# EAGLE design AUDIO_final_rev03 (EAGLE 9.6.2)
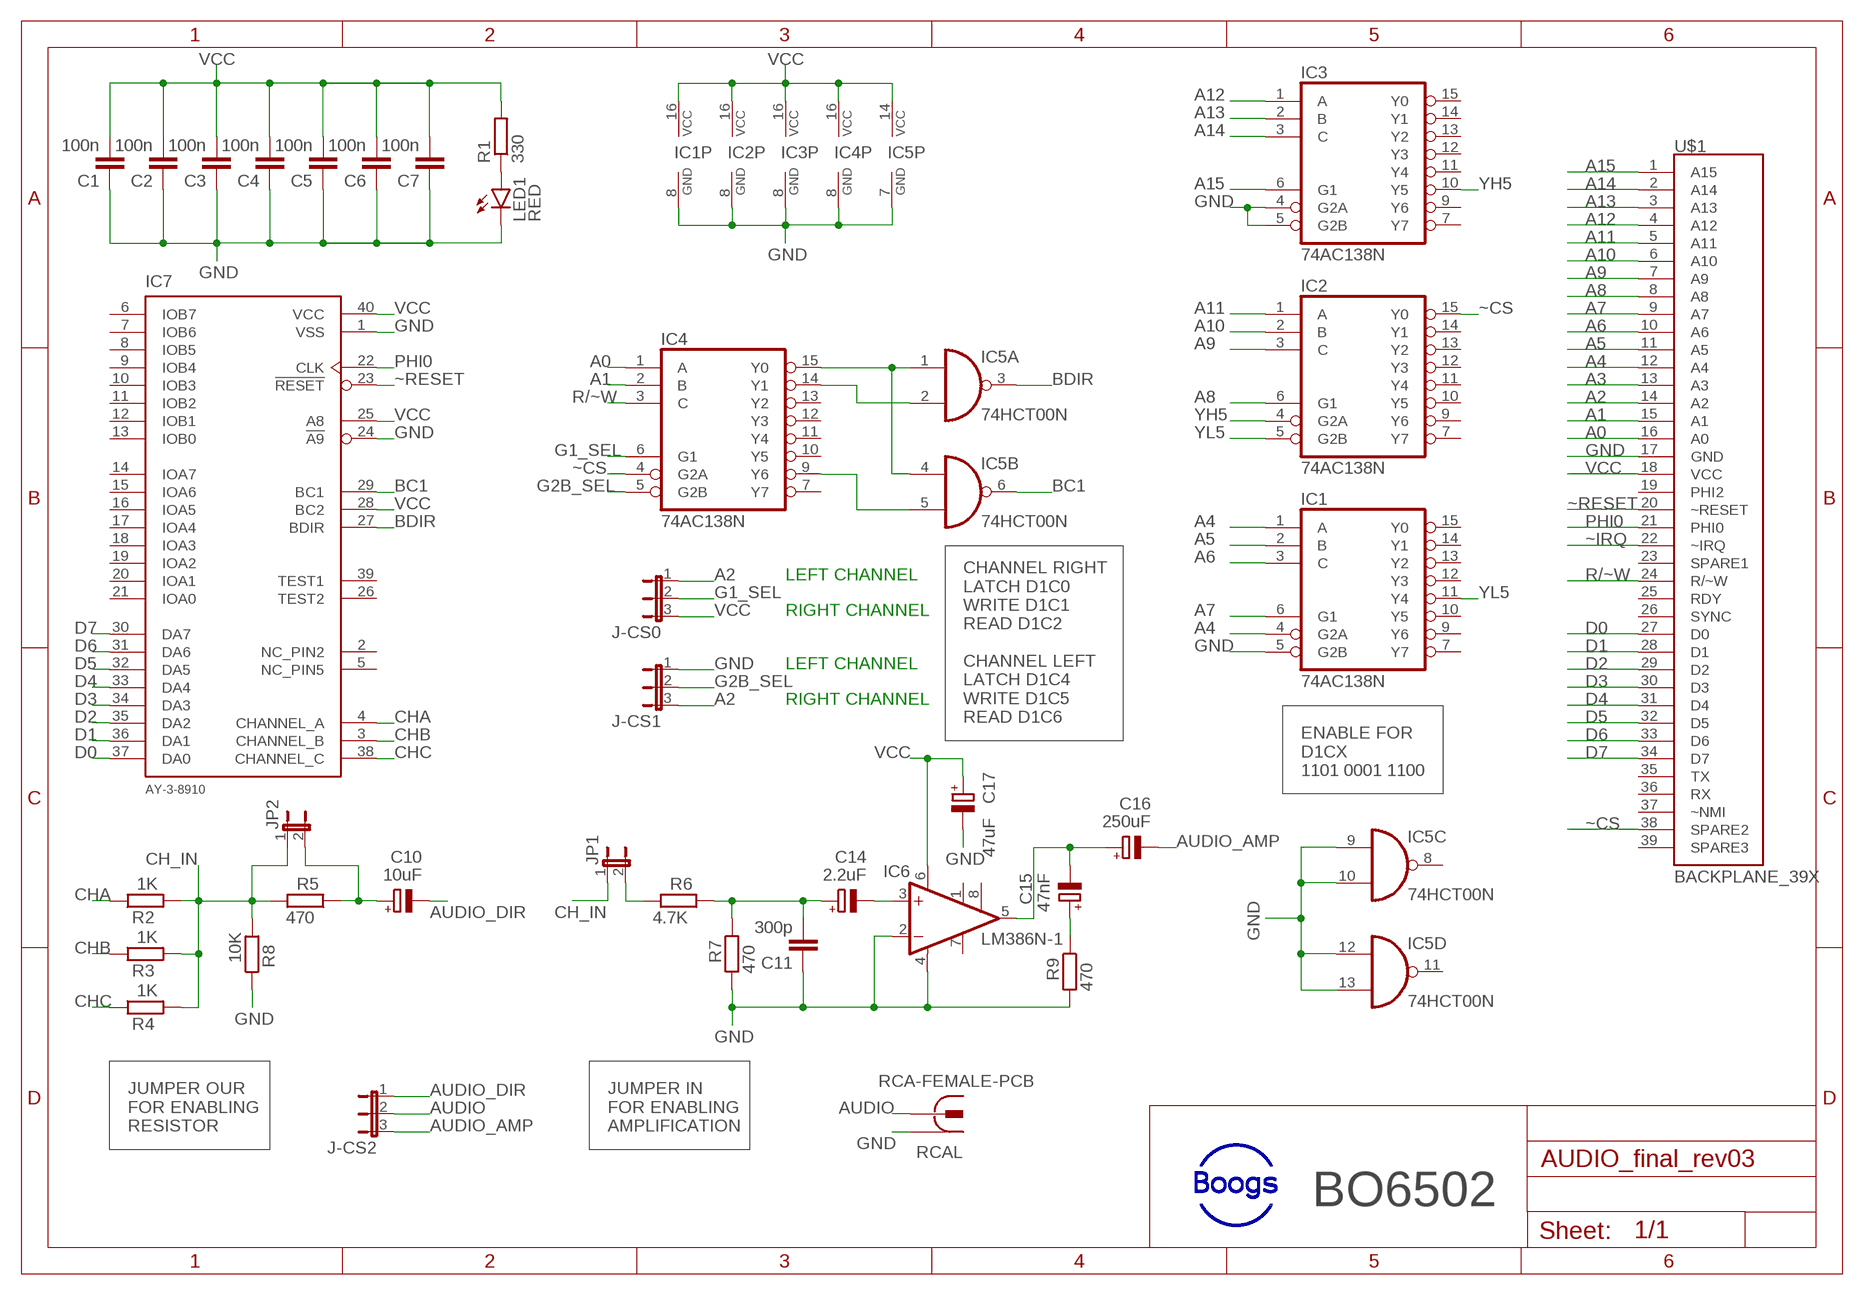
[diagram p0: schematic, sheet 1]

## Parts
C1  100n  C-EU025-025X050  [C025-025X050]
C2  100n  C-EU025-025X050  [C025-025X050]
C3  100n  C-EU025-025X050  [C025-025X050]
C4  100n  C-EU025-025X050  [C025-025X050]
C5  100n  C-EU025-025X050  [C025-025X050]
C6  100n  C-EU025-025X050  [C025-025X050]
C7  100n  C-EU025-025X050  [C025-025X050]
C10  10uF  CPOL-EUB45181A  [B45181A]
C11  300p  C-EU025-025X050  [C025-025X050]
C14  2.2uF  CPOL-EUB45181A  [B45181A]
C15  47nF  CPOL-EUB45181A  [B45181A]
C16  250uF  CPOL-EUB45181A  [B45181A]
C17  47uF  CPOL-EUB45181A  [B45181A]
IC1  74AC138N  [DIL16]
IC2  74AC138N  [DIL16]
IC3  74AC138N  [DIL16]
IC4  74AC138N  [DIL16]
IC5  74HCT00N  [DIL14]
IC6  LM386N-1  [DIL08]
IC7  AY-3-8910  [DIL40]
J-CS0  J-CS0  JP2E  [JP2]
J-CS1  J-CS1  JP2E  [JP2]
J-CS2  J-CS2  JP2E  [JP2]
JP1  2PIN  JP1E  [JP1]
JP2  2PIN  JP1E  [JP1]
LED1  RED  LED5MM  [LED5MM]
R1  330  R-EU_0207/10  [0207/10]
R2  1K  R-EU_0207/10  [0207/10]
R3  1K  R-EU_0207/10  [0207/10]
R4  1K  R-EU_0207/10  [0207/10]
R5  470  R-EU_0207/10  [0207/10]
R6  4.7K  R-EU_0207/10  [0207/10]
R7  470  R-EU_0207/10  [0207/10]
R8  10K  R-EU_0207/10  [0207/10]
R9  470  R-EU_0207/10  [0207/10]
RCAL  RCA-FEMALE-PCB  [RCA-FEMALE-PCB]
U$1  BACKPLANE_39X  [BP_39X]

## Nets
A0: IC4.1(A) U$1.16(A0)
A1: IC4.2(B) U$1.15(A1)
A2: J-CS0.1 J-CS1.3 U$1.14(A2)
A3: U$1.13(A3)
A4: IC1.1(A) IC1.4(G2A) U$1.12(A4)
A5: IC1.2(B) U$1.11(A5)
A6: IC1.3(C) U$1.10(A6)
A7: IC1.6(G1) U$1.9(A7)
A8: IC2.6(G1) U$1.8(A8)
A9: IC2.3(C) U$1.7(A9)
A10: IC2.2(B) U$1.6(A10)
A11: IC2.1(A) U$1.5(A11)
A12: IC3.1(A) U$1.4(A12)
A13: IC3.2(B) U$1.3(A13)
A14: IC3.3(C) U$1.2(A14)
A15: IC3.6(G1) U$1.1(A15)
AUDIO: J-CS2.2 RCAL.2@1 RCAL.2@2
AUDIO_AMP: C16.- J-CS2.3
AUDIO_DIR: C10.- J-CS2.1
BC1: IC5.6(B:O) IC7.29(BC1)
BDIR: IC5.3(A:O) IC7.27(BDIR)
CH_IN: JP1.1 JP2.1 R2.2 R3.2 R4.2 R5.2 R8.2
CHA: IC7.4(CHANNEL_A) R2.1
CHB: IC7.3(CHANNEL_B) R3.1
CHC: IC7.38(CHANNEL_C) R4.1
D0: IC7.37(DA0) U$1.27(D0)
D1: IC7.36(DA1) U$1.28(D1)
D2: IC7.35(DA2) U$1.29(D2)
D3: IC7.34(DA3) U$1.30(D3)
D4: IC7.33(DA4) U$1.31(D4)
D5: IC7.32(DA5) U$1.32(D5)
D6: IC7.31(DA6) U$1.33(D6)
D7: IC7.30(DA7) U$1.34(D7)
G1_SEL: IC4.6(G1) J-CS0.2
G2B_SEL: IC4.5(G2B) J-CS1.2
GND: C1.1 C2.1 C3.1 C4.1 C5.1 C6.1 C7.1 C11.1 C17.- IC1.5(G2B) IC1.8(GND) IC2.8(GND) IC3.4(G2A) IC3.5(G2B) IC3.8(GND) IC4.8(GND) IC5.7(P:GND) IC5.9(C:I0) IC5.10(C:I1) IC5.12(D:I0) IC5.13(D:I1) IC6.2(-IN) IC6.4(GND) IC7.1(VSS) IC7.24(!A9) J-CS1.1 LED1.K(C) R7.2 R8.1 R9.2 RCAL.1 U$1.17(GND)
N$1: JP1.2 R6.2
N$2: IC4.15(Y0) IC5.1(A:I0) IC5.4(B:I0)
N$3: C14.- IC6.3(+IN)
N$5: IC4.14(Y1) IC5.2(A:I1)
N$6: LED1.A R1.1
N$10: C10.+ JP2.2 R5.1
N$11: IC4.9(Y6) IC5.5(B:I1)
N$12: C11.2 C14.+ R6.1 R7.1
N$13: C15.- C16.+ IC6.5(OUT)
N$14: C15.+ R9.1
PHI0: IC7.22(CLK) U$1.21(PHI0)
R/~W: IC4.3(C) U$1.24(R/~W)
VCC: C1.2 C2.2 C3.2 C4.2 C5.2 C6.2 C7.2 C17.+ IC1.16(VCC) IC2.16(VCC) IC3.16(VCC) IC4.16(VCC) IC5.14(P:VCC) IC6.6(VS) IC7.25(A8) IC7.28(BC2) IC7.40(VCC) J-CS0.3 R1.2 U$1.18(VCC)
YH5: IC2.4(G2A) IC3.10(Y5)
YL5: IC1.11(Y4) IC2.5(G2B)
~CS: IC2.15(Y0) IC4.4(G2A) U$1.38(SPARE2)
~IRQ: U$1.22(~IRQ)
~RESET: IC7.23(!RESET) U$1.20(~RESET)
Unconnected: IC1.7(Y7) IC1.9(Y6) IC1.10(Y5) IC1.12(Y3) IC1.13(Y2) IC1.14(Y1) IC1.15(Y0) IC2.7(Y7) IC2.9(Y6) IC2.10(Y5) IC2.11(Y4) IC2.12(Y3) IC2.13(Y2) IC2.14(Y1) IC3.7(Y7) IC3.9(Y6) IC3.11(Y4) IC3.12(Y3) IC3.13(Y2) IC3.14(Y1) IC3.15(Y0) IC4.7(Y7) IC4.10(Y5) IC4.11(Y4) IC4.12(Y3) IC4.13(Y2) IC5.8(C:O) IC5.11(D:O) IC6.1(GAIN) IC6.7(BYPASS) IC6.8(GAIN) IC7.2(NC_PIN2) IC7.5(NC_PIN5) IC7.6(IOB7) IC7.7(IOB6) IC7.8(IOB5) IC7.9(IOB4) IC7.10(IOB3) IC7.11(IOB2) IC7.12(IOB1) IC7.13(IOB0) IC7.14(IOA7) IC7.15(IOA6) IC7.16(IOA5) IC7.17(IOA4) IC7.18(IOA3) IC7.19(IOA2) IC7.20(IOA1) IC7.21(IOA0) IC7.26(TEST2) IC7.39(TEST1) U$1.19(PHI2) U$1.23(SPARE1) U$1.25(RDY) U$1.26(SYNC) U$1.35(TX) U$1.36(RX) U$1.37(~NMI) U$1.39(SPARE3)

## Notes on the sheet
- LEFT CHANNEL
- RIGHT CHANNEL
- LEFT CHANNEL
- RIGHT CHANNEL
- CHANNEL RIGHT
  LATCH D1C0
  WRITE D1C1
  READ D1C2
  
  CHANNEL LEFT
  LATCH D1C4
  WRITE D1C5
  READ D1C6
- ENABLE FOR
  D1CX
  1101 0001 1100
- JUMPER OUR
  FOR ENABLING
  RESISTOR
- JUMPER IN
  FOR ENABLING
  AMPLIFICATION
- BO6502

## Library data of the parts
C1-C7 C11 = rcl:C-EU: CAPACITOR, European symbol; SPICEPREFIX: C
C10 C14-C17 = rcl:CPOL-EU: POLARIZED CAPACITOR, European symbol; SPICEPREFIX: C
IC1-IC4 = 74xx-eu:74*138: 3-line to 8-line DECODER/DEMULTIPLEXER
IC5 = 74xx-eu:74*00: Quad 2-input NAND gate
IC6 = linear:LM386?-*: Low Voltage Audio Power Amplifier Source: http://cache.national.com/ds/LM/LM386.pdf
IC7 = AY-3-8910:AY-3-8910: Check availability <https://pricing.snapeda.com/parts/AY-3-8910/General%20Instrument/view-part?ref=eda>; AVAILABILITY: Not in stock; CHECK_PRICES: https://www.snapeda.com/parts/AY-3-8910/General/view-part/?ref=eda; MF: General Instrument; MP: AY-3-8910; PACKAGE: None; PRICE: None; SNAPEDA_LINK: https://www.snapeda.com/parts/AY-3-8910/General/view-part/?ref=snap
J-CS0 J-CS1 J-CS2 = jumper:JP2E: JUMPER
JP1 JP2 = jumper:JP1E: JUMPER
LED1 = led:LED: LED OSRAM: - CHIPLED LG R971, LG N971, LY N971, LG Q971, LY Q971, LO R971, LY R971 LH N974, LH R974 LS Q976, LO Q976, LY Q976 LO Q996 - Hyper CHIPLED LW Q18S LB Q993, LB Q99A, LB R99A - SideLED LS A670, LO A670, LY A670, LG A670, LP A670 LB A673, LV A673, LT A673, LW A673 LH A674 LY A675 LS A676, LA A676, LO A676, LY A676, LW A676 LS A679, LY A679, LG A679 - Hyper Micro SIDELED® LS Y876, LA Y876, LO Y876, LY Y876 LT Y87S - SmartLED LW L88C, LW L88S LB L89C, LB L89S, LG L890 LS L89K, LO L89K, LY L89K LS L896, LA L896, LO L896, LY L896 - TOPLED LS T670, LO T670, LY T670, LG T670, LP T670 LSG T670, LSP T670, LSY T670, LOP T670, LYG T670 LG T671, LOG T671, LSG T671 LB T673, LV T673, LT T673, LW T673 LH T674 LS T676, LA T676, LO T676, LY T676, LB T676, LH T676, LSB T676, LW T676 LB T67C, LV T67C, LT T67C, LS T67K, LO T67K, LY T67K, LW E67C LS E67B, LA E67B, LO E67B, LY E67B, LB E67C, LV E67C, LT E67C LW T67C LS T679, LY T679, LG T679 LS T770, LO T770, LY T770, LG T770, LP T770 LB T773, LV T773, LT T773, LW T773 LH T774 LS E675, LA E675, LY E675, LS T675 LS T776, LA T776, LO T776, LY T776, LB T776 LHGB T686 LT T68C, LB T68C - Hyper Mini TOPLED® LB M676 - Mini TOPLED Santana® LG M470 LS M47K, LO M47K, LY M47K Source: http://www.osram.convergy.de LUXEON: - LUMILED® LXK2-PW12-R00, LXK2-PW12-S00, LXK2-PW14-U00, LXK2-PW14-V00 LXK2-PM12-R00, LXK2-PM12-S00, LXK2-PM14-U00 LXK2-PE12-Q00, LXK2-PE12-R00, LXK2-PE12-S00, LXK2-PE14-T00, LXK2-PE14-U00 LXK2-PB12-K00, LXK2-PB12-L00, LXK2-PB12-M00, LXK2-PB14-N00, LXK2-PB14-P00, LXK2-PB14-Q00 LXK2-PR12-L00, LXK2-PR12-M00, LXK2-PR14-Q00, LXK2-PR14-R00 LXK2-PD12-Q00, LXK2-PD12-R00, LXK2-PD12-S00 LXK2-PH12-R00, LXK2-PH12-S00 LXK2-PL12-P00, LXK2-PL12-Q00, LXK2-PL12-R00 Source: www.luxeon.com KINGBRIGHT: KA-3528ASYC Source: www.kingbright.com
R1-R9 = rcl:R-EU_: RESISTOR, European symbol; SPICEPREFIX: R
RCAL = 65xx_family:RCA-FEMALE-PCB
U$1 = 65xx_family:BACKPLANE_39X

## Board
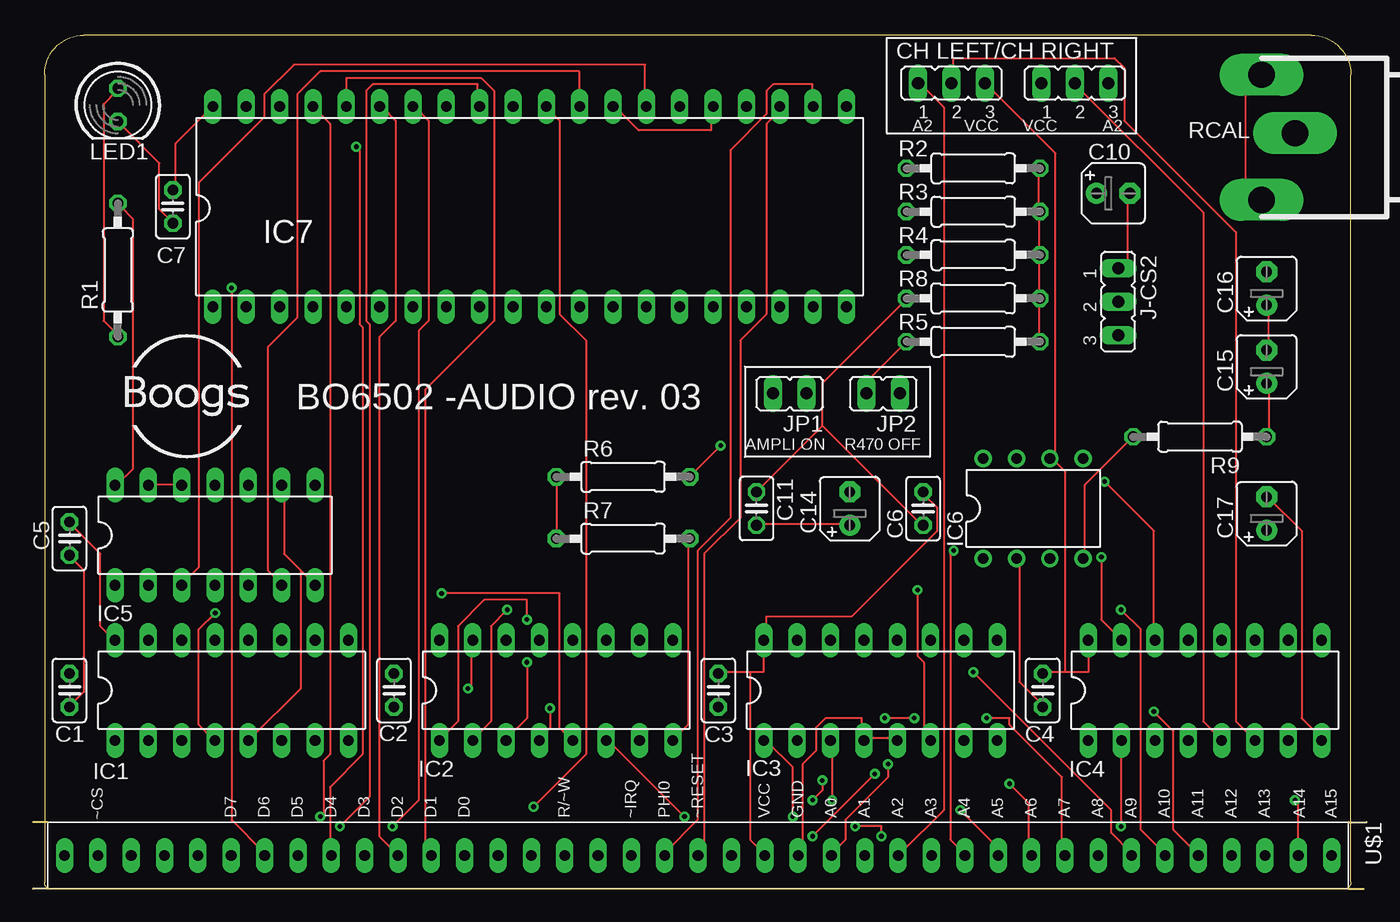
[diagram p1: board, top side]
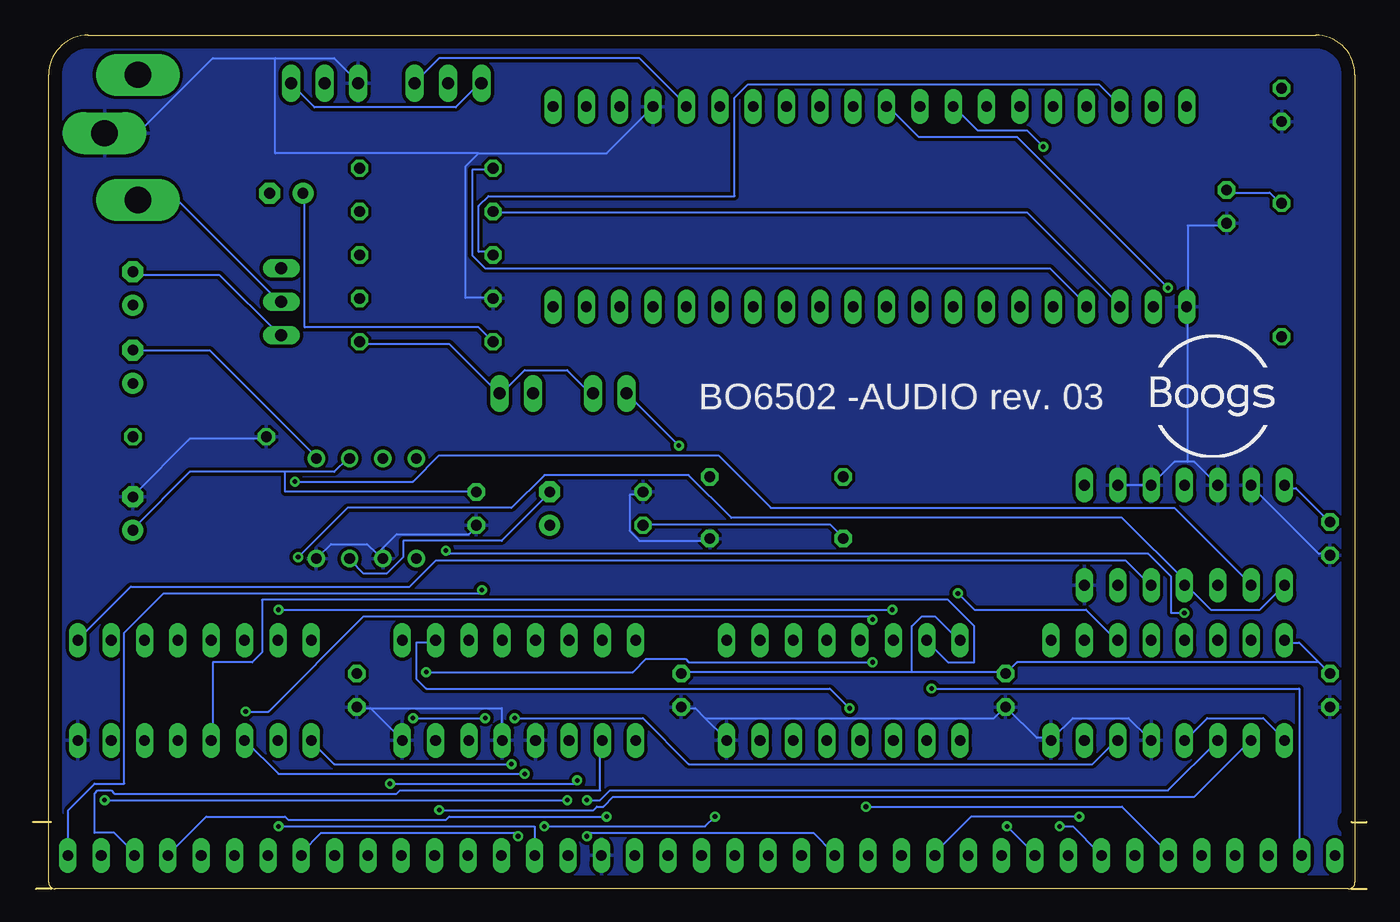
[diagram p2: board, bottom side, seen from below]

Size 101.6 x 65 mm. Coordinates in mm from the lower left corner, seen from the top.
Outline: 1.14,5.08 0,5.08
Outline: 1.14,0 0,0
Outline: 100.2,5.08 101.6,5.08
Outline: 100.2,0 101.35,0
Outline: 1.39,0 99.89,0 arc90 100.39,0.5 100.39,62 arc90 97.39,65 3.89,65 arc90 0.89,62 0.89,0.5 arc90 1.39,0
Copper layers (1*16): Top 0.035mm / dielectric 1.5mm / Bottom 0.035mm
Design rules "default *": minimum track width 6mil, minimum drill 0.35mm, track to track 10mil, track to pad 10mil, pad to pad 10mil, via to via 10mil, smd to smd 6mil, copper to edge 40mil, drill to drill 6mil, minimum pad ring 10mil, minimum via ring 8mil, stop-mask expansion 4mil, vias tented up to drill 15mil, thermal gap 10mil

### Footprints (pad centres in the part's own frame; a part is rotated, then mirrored left to right if it is on the bottom)
C025-025X050 = drill 0.813 octagon: 1 -1.27,0; 2 1.27,0
B45181A = drill 0.813 pad 1.6: + -1.27,0 | drill 0.813 pad 1.6 octagon: - 1.27,0
DIL16 = drill 0.813 long: 1 -8.89,-3.81; 2 -6.35,-3.81; 3 -3.81,-3.81; 4 -1.27,-3.81; 5 1.27,-3.81; 6 3.81,-3.81; 7 6.35,-3.81; 8 8.89,-3.81; 9 8.89,3.81; 10 6.35,3.81; 11 3.81,3.81; 12 1.27,3.81; 13 -1.27,3.81; 14 -3.81,3.81; 15 -6.35,3.81; 16 -8.89,3.81
DIL14 = drill 0.813 long: 1 -7.62,-3.81; 2 -5.08,-3.81; 3 -2.54,-3.81; 4 0,-3.81; 5 2.54,-3.81; 6 5.08,-3.81; 7 7.62,-3.81; 8 7.62,3.81; 9 5.08,3.81; 10 2.54,3.81; 11 0,3.81; 12 -2.54,3.81; 13 -5.08,3.81; 14 -7.62,3.81
DIL08 = drill 0.813 pad 1.27: 1 -3.81,-3.81; 2 -1.27,-3.81; 3 1.27,-3.81; 4 3.81,-3.81; 5 3.81,3.81; 6 1.27,3.81; 7 -1.27,3.81; 8 -3.81,3.81
DIL40 = drill 0.813 long: 1 -24.13,-7.62; 2 -21.59,-7.62; 3 -19.05,-7.62; 4 -16.51,-7.62; 5 -13.97,-7.62; 6 -11.43,-7.62; 7 -8.89,-7.62; 8 -6.35,-7.62; 9 -3.81,-7.62; 10 -1.27,-7.62; 11 1.27,-7.62; 12 3.81,-7.62; 13 6.35,-7.62; 14 8.89,-7.62; 15 11.43,-7.62; 16 13.97,-7.62; 17 16.51,-7.62; 18 19.05,-7.62; 19 21.59,-7.62; 20 24.13,-7.62; 21 24.13,7.62; 22 21.59,7.62; 23 19.05,7.62; 24 16.51,7.62; 25 13.97,7.62; 26 11.43,7.62; 27 8.89,7.62; 28 6.35,7.62; 29 3.81,7.62; 30 1.27,7.62; 31 -1.27,7.62; 32 -3.81,7.62; 33 -6.35,7.62; 34 -8.89,7.62; 35 -11.43,7.62; 36 -13.97,7.62; 37 -16.51,7.62; 38 -19.05,7.62; 39 -21.59,7.62; 40 -24.13,7.62
JP2 = drill 0.914 long: 1 -2.54,0; 2 0,0; 3 2.54,0
JP1 = drill 0.914 long: 1 0,-1.27; 2 0,1.27
LED5MM = drill 0.813 octagon: A -1.27,0; K 1.27,0
0207/10 = drill 0.813 octagon: 1 -5.08,0; 2 5.08,0
RCA-FEMALE-PCB = drill 2 pad 3.2 long: 1 2.54,0; 2@1 5.08,5.08; 2@2 5.08,-4.445
BP_39X = drill 0.813 long: 1 1.27,59.69; 2 1.27,57.15; 3 1.27,54.61; 4 1.27,52.07; 5 1.27,49.53; 6 1.27,46.99; 7 1.27,44.45; 8 1.27,41.91; 9 1.27,39.37; 10 1.27,36.83; 11 1.27,34.29; 12 1.27,31.75; 13 1.27,29.21; 14 1.27,26.67; 15 1.27,24.13; 16 1.27,21.59; 17 1.27,19.05; 18 1.27,16.51; 19 1.27,13.97; 20 1.27,11.43; 21 1.27,8.89; 22 1.27,6.35; 23 1.27,3.81; 24 1.27,1.27; 25 1.27,-1.27; 26 1.27,-3.81; 27 1.27,-6.35; 28 1.27,-8.89; 29 1.27,-11.43; 30 1.27,-13.97; 31 1.27,-16.51; 32 1.27,-19.05; 33 1.27,-21.59; 34 1.27,-24.13; 35 1.27,-26.67; 36 1.27,-29.21; 37 1.27,-31.75; 38 1.27,-34.29; 39 1.27,-36.83

### Placement (x,y rotation side)
C1  2.79,15.11 90 top
C2  27.5,15.11 90 top
C3  52.22,15.11 90 top
C4  76.93,15.11 90 top
C5  2.79,26.67 90 top
C6  67.82,28.96 90 top
C7  10.67,51.94 90 top
C10  82.3,52.96 0 top
C11  55.12,28.96 270 top
C14  62.23,28.96 90 top
C15  93.98,39.75 90 top
C16  93.98,45.72 90 top
C17  93.98,28.57 90 top
IC1  15.15,15.11 0 top
IC2  39.86,15.11 0 top
IC3  64.57,15.11 0 top
IC4  89.28,15.11 0 top
IC5  13.88,26.92 0 top
IC6  76.2,28.96 0 top
IC7  37.85,51.94 0 top
J-CS0  69.98,61.34 0 top
J-CS1  79.38,61.34 0 top
J-CS2  82.68,44.7 270 top
JP1  57.66,37.72 90 top
JP2  64.77,37.72 90 top
LED1  6.48,59.69 270 top
R1  6.48,47.12 90 top
R2  71.63,54.86 0 top
R3  71.63,51.56 0 top
R4  71.63,48.26 0 top
R5  71.63,41.66 0 top
R6  44.96,31.37 0 top
R7  44.96,26.67 0 top
R8  71.63,44.96 0 top
R9  88.9,34.42 180 top
RCAL  98.68,57.53 180 top
U$1  39.24,3.81 270 top

### Tracks (layer width: path | path; a pad name or v marks a point on that pad's centre or on a via)
A0  (via drill 0.35)
  Top 0.152: v65.14,9.5 65.14,8.5 61.89,5.25 61.89,3.75 60.89,2.75 U$1.16
  Bottom 0.152: v65.14,9.5 78.64,9.5 80.39,11.25 IC4.1
A1  (via drill 0.35)
  Top 0.152: v82.89,4.75 82.89,11.25 IC4.2
  Bottom 0.152: v82.89,4.75 63.39,4.75 63.39,2.75 U$1.15
A2
  Top 0.152: U$1.14 66.14,2.75 69.39,6 69.39,59.5 67.64,61.25 J-CS0.1
  Bottom 0.152: J-CS1.3 81.89,61.25 80.14,59.5 69.39,59.5 67.64,61.25 J-CS0.1
A4  (via drill 0.35)
  Top 0.152: v70.14,25.75 69.89,25.5 69.89,3.75 70.89,2.75 U$1.12 | v13.89,21 12.64,19.75 12.64,12.5 13.64,11.5 IC1.4
  Bottom 0.152: IC1.1 6.39,11.5 7.89,13 12.14,13 13.64,11.5 IC1.4 | v70.14,25.75 69.89,25.5 16.64,25.5 14.89,23.75 14.89,21 v13.89,21
A5  (via drill 0.35)
  Top 0.152: v70.64,6 73.39,3.25 73.39,2.75 U$1.11
  Bottom 0.152: v70.64,6 58.89,6 58.64,6.25 58.14,6.25 57.39,7 13.14,7 8.89,11.25 IC1.2
A6  (via drill 0.35)
  Top 0.152: v59.39,6.75 60.14,7.5 v60.14,8.25 | v74.39,8 75.89,6.5 75.89,2.75 U$1.10
  Bottom 0.152: v59.39,6.75 58.39,6.75 57.64,7.5 15.14,7.5 11.39,11.25 IC1.3 | v60.14,8.25 60.39,8 v74.39,8
A7  (via drill 0.35)
  Top 0.152: v67.14,13 v64.89,13 | v72.64,13 74.39,13 74.39,12.5 78.39,8.5 78.39,2.75 U$1.9
  Bottom 0.152: v64.89,13 55.14,13 51.64,9.5 20.89,9.5 19.14,11.25 IC1.6 | v72.64,13 v67.14,13
A8  (via drill 0.35)
  Top 0.152: v49.64,5.5 43.89,11.25 IC2.6 | v62.64,4.75 64.64,4.75 v64.64,4
  Bottom 0.152: v49.64,5.5 50.39,4.75 v62.64,4.75 | v64.64,4 64.89,4.25 79.64,4.25 81.14,2.75 U$1.8
A9  (via drill 0.35)
  Top 0.152: v37.64,17.25 37.64,13 36.14,11.5 IC2.3 | v71.64,16.5 82.14,6 82.14,4.25 83.64,2.75 U$1.7
  Bottom 0.152: v37.64,17.25 51.64,17.25 51.89,17.5 54.89,17.5 55.89,16.5 v71.64,16.5
A10  (via drill 0.35)
  Top 0.152: v36.14,21.25 34.89,20 34.89,12.75 33.64,11.5 IC2.2 | v82.89,21.25 84.39,19.75 84.39,4.5 86.14,2.75 U$1.6
  Bottom 0.152: v82.89,21.25 v36.14,21.25
A11  (via drill 0.35)
  Top 0.152: v37.64,20.5 37.64,22 34.39,22 32.39,20 32.39,12.75 31.14,11.5 IC2.1 | v85.39,13.5 86.89,12 86.89,4.5 88.64,2.75 U$1.5
  Bottom 0.152: v37.64,20.5 37.89,20.75 76.39,20.75 83.64,13.5 v85.39,13.5
A12  (via drill 0.35)
  Top 0.152: v57.89,5.5 57.89,9.25 55.89,11.25 IC3.1
  Bottom 0.152: v57.89,5.5 69.89,5.5 70.14,5.25 82.14,5.25 82.39,5.5 88.39,5.5 91.14,2.75 U$1.4
A13
  Bottom 0.152: IC3.2 58.39,11.25 58.39,7.5 73.64,7.5 73.89,7.25 95.39,7.25 95.64,7.5 96.64,7.5 96.89,7.25 96.89,4.25 95.39,4.25 93.89,2.75 U$1.3
A14  (via drill 0.35)
  Top 0.152: v60.89,6.75 60.89,11.25 IC3.3 | v96.14,6.75 96.39,6.5 96.39,2.75 U$1.2
  Bottom 0.152: v96.14,6.75 v60.89,6.75
A15  (via drill 0.35)
  Top 0.152: v67.39,22.75 67.39,17.75 67.89,17.25 67.89,11.75 68.14,11.5 IC3.6
  Bottom 0.152: v67.39,22.75 67.64,22.5 91.64,22.5 94.64,19.5 94.64,8 96.89,8 98.89,6 98.89,2.75 U$1.1
AUDIO
  Top 0.152: RCAL.2@2 93.39,61.75 92.39,60.75 92.39,53.5 93.39,52.5 RCAL.2@1
  Bottom 0.152: J-CS2.2 82.89,44.75 90.39,52.25 93.39,52.25 RCAL.2@1
AUDIO_AMP
  Bottom 0.152: J-CS2.3 82.89,42.25 87.39,46.75 93.89,46.75 C16.-
AUDIO_DIR
  Top 0.152: J-CS2.1 82.89,47.25 83.39,47.75 83.39,52.75 C10.-
BC1
  Top 0.152: IC5.6 18.89,23.25 17.89,24.25 17.89,41.25 20.14,43.5 20.14,60.5 21.89,62.25 41.64,62.25 41.64,59.75 IC7.29
BDIR
  Top 0.152: IC5.3 11.39,23.25 12.64,24.5 12.64,53.75 17.64,58.75 17.64,60.5 19.89,62.75 46.64,62.75 46.64,59.75 IC7.27
CH_IN
  Top 0.152: R5.2 76.64,41.75 76.64,44.75 R8.2 76.64,45 76.64,48.25 R4.2 76.64,48.5 76.64,51.5 R3.2 76.64,51.75 76.64,54.75 R2.2
  Bottom 0.152: JP1.1 59.14,37.75 60.89,39.5 64.14,39.5 65.89,37.75 JP2.1 66.14,37.75 69.89,41.5 76.64,41.5 R5.2
CHA
  Bottom 0.152: IC7.4 21.39,44.5 24.14,47.25 67.14,47.25 68.14,48.25 68.14,54.75 66.64,54.75 R2.1
CHB
  Bottom 0.152: IC7.3 18.89,44.5 25.89,51.5 66.39,51.5 R3.1
CHC
  Bottom 0.152: IC7.38 18.89,59.75 20.39,61.25 47.14,61.25 48.14,60.25 48.14,52.75 66.89,52.75 67.64,52 67.64,48.5 66.64,48.5 R4.1
D0  (via drill 0.35)
  Top 0.152: v21.89,5.5 22.14,5.75 22.14,9.75 22.64,10.25 22.64,58.25 21.39,59.5 IC7.37
  Bottom 0.152: v21.89,5.5 30.14,5.5 32.89,2.75 U$1.27
D1
  Top 0.152: U$1.28 30.14,2.75 29.89,3 29.89,38 35.14,43.25 35.14,60.75 34.14,61.75 23.89,61.75 23.89,59.75 IC7.36
D2
  Top 0.152: U$1.29 27.64,2.75 26.39,4 26.39,42 27.64,43.25 27.64,58.5 26.64,59.5 IC7.35
D3  (via drill 0.35)
  Top 0.152: v27.39,4.75 29.39,6.75 29.39,42.5 30.14,43.25 30.14,58.5 29.14,59.5 IC7.34
  Bottom 0.152: v27.39,4.75 25.39,2.75 U$1.30
D4  (via drill 0.35)
  Top 0.152: v24.64,56.5 24.89,56.25 24.89,43 25.14,42.75 25.14,10.25 22.64,7.75 22.64,2.75 U$1.31
  Bottom 0.152: v24.64,56.5 25.89,57.75 29.64,57.75 31.39,59.5 IC7.33
D5  (via drill 0.35)
  Top 0.152: v23.39,4.75 25.64,7 25.64,43 25.39,43.25 25.39,60.75 25.89,61.25 33.89,61.25 33.89,59.75 IC7.32
  Bottom 0.152: v23.39,4.75 22.39,4.75 20.39,2.75 U$1.32
D6  (via drill 0.35)
  Top 0.152: v15.14,45.75 15.14,5.25 17.64,2.75 U$1.33
  Bottom 0.152: v15.14,45.75 26.64,57.25 34.14,57.25 36.39,59.5 IC7.31
D7  (via drill 0.35)
  Top 0.152: v38.14,6.25 42.14,10.25 42.14,41.75 40.14,43.75 40.14,58.5 39.14,59.5 IC7.30
  Bottom 0.152: v38.14,6.25 18.64,6.25 15.14,2.75 U$1.34
G1_SEL
  Top 0.152: IC4.6 92.89,11.5 91.64,12.75 91.64,50 83.14,58.5 83.14,62.5 82.39,63.25 70.14,63.25 70.14,61.5 J-CS0.2
G2B_SEL
  Top 0.152: IC4.5 90.39,11.5 89.14,12.75 89.14,51.5 79.39,61.25 J-CS1.2
GND
  Top 0.152: LED1.K 6.64,58.25 9.64,55.25 9.64,51.75 10.64,50.75 C7.1 | 20.39,24.25 19.14,25.5 19.14,30.5 IC5.9 | 20.39,24.25 21.39,23.25 IC5.7 | IC5.13 8.89,30.75 11.14,30.75 IC5.12 | C1.1 2.89,14 3.89,15 3.89,24.25 2.89,25.25 C5.1 | 20.39,24.25 20.39,15.25 16.64,11.5 IC1.5 | IC4.8 98.14,11.5 96.64,13 96.64,27.25 94.14,29.75 C17.- | U$1.17 58.39,2.75 58.64,3 58.64,9.5 59.64,10.5 59.64,12.25 60.39,13 63.14,13 63.14,11.5 IC3.4 63.39,11.5 65.64,11.5 IC3.5 | R9.2 83.64,34.25 80.14,30.75 80.14,25.25 IC6.4 | C4.1 76.89,14 75.14,15.75 75.14,25 IC6.2 | 60.14,35.25 60.14,38.5 66.39,44.75 R8.1 | 60.14,35.25 55.14,30.25 C11.1 | IC2.8 48.89,11.5 49.89,12.5 49.89,26.5 R7.2 | 60.14,35.25 67.64,27.75 C6.1
  Bottom 0.152: C7.1 10.89,50.5 13.64,50.5 13.64,44.5 IC7.1 13.64,44.25 13.64,32.5 | IC1.5 16.64,11.5 18.14,13 22.39,13 23.89,11.5 IC1.8 24.14,11.5 25.14,11.5 27.39,13.75 C2.1 27.64,13.75 28.39,13 50.39,13 | IC5.9 18.89,30.75 16.64,30.75 IC5.10 16.39,30.75 14.64,32.5 13.64,32.5 | IC5.13 8.64,30.5 3.64,25.5 2.89,25.5 C5.1 | 13.64,32.5 13.14,32.5 11.39,30.75 IC5.12 | 75.89,13.75 73.64,11.5 IC3.8 | 75.89,13.75 76.89,13.75 C4.1 | 75.39,25.5 76.14,26.25 78.89,26.25 79.89,25.25 IC6.4 | 75.39,25.5 75.14,25.25 IC6.2 75.39,25.5 | 75.39,25.5 73.89,27 68.39,27 67.89,27.5 C6.1 | 75.89,13.75 65.89,13.75 65.89,11.5 IC3.5 | C17.- 93.89,30 89.64,34.25 83.89,34.25 R9.2 | 83.14,63.25 87.89,63.25 93.39,57.75 96.14,57.75 RCAL.1 | 83.14,63.25 78.64,63.25 76.89,61.5 J-CS1.1 | 50.39,13 51.14,13.75 52.14,13.75 C3.1 | 50.39,13 48.89,11.5 IC2.8 | R7.2 50.14,26.5 55.39,26.5 56.14,27.25 56.14,30 55.14,30 C11.1 | 67.64,56 57.89,56 54.39,59.5 IC7.24 | 67.64,56 68.64,55 68.64,45 66.64,45 R8.1 | 83.14,63.25 83.14,56 67.64,56
  pour Bottom: 1.14,0.13 1.14,62.87 1.65,63.37 3.05,64.77 3.3,64.77 98.17,64.77 99.57,63.37 100.2,62.74 100.2,62.1 100.2,0.38 1.4,0.38
N$1  (via drill 0.35)
  Top 0.152: v52.39,33.75 50.14,31.5 R6.2
  Bottom 0.152: v52.39,33.75 56.14,37.5 JP1.2
N$2  (via drill 0.35)
  Top 0.152: v81.39,25.25 81.39,20.5 82.89,19 IC4.15
  Bottom 0.152: IC5.1 6.39,23 8.14,21.25 11.89,21.25 13.64,23 IC5.4 13.64,23.25 18.64,28.25 48.39,28.25 51.64,31.5 62.64,31.5 65.14,29 77.64,29 v81.39,25.25
N$3
  Bottom 0.152: IC6.3 77.39,25 76.39,24 74.64,24 73.39,25.25 73.39,26.5 65.89,26.5 62.39,30 C14.-
N$5  (via drill 0.35)
  Top 0.152: v81.64,31 85.39,27.25 85.39,19 IC4.14
  Bottom 0.152: v81.64,31 72.64,31 70.64,33 49.39,33 45.39,29 14.64,29 8.89,23.25 IC5.2
N$6
  Top 0.152: R1.1 6.39,42.25 5.39,43.25 5.39,59.75 6.39,60.75 LED1.A
N$10
  Top 0.152: R5.1 66.39,41.5 63.64,38.75 63.64,37.75 JP2.2
  Bottom 0.152: C10.+ 80.89,52.75 80.89,42.75 67.64,42.75 66.64,41.75 R5.1
N$11
  Bottom 0.152: IC5.5 16.64,23.25 18.39,25 70.89,25 72.89,23 94.14,23 98.14,19 IC4.9
N$12
  Top 0.152: R7.1 39.89,26.75 39.89,31.25 R6.1 | C11.2 55.14,27.75 62.14,27.75 C14.+
  Bottom 0.152: R7.1 39.89,26.75 40.89,27.75 54.89,27.75 C11.2
N$13
  Top 0.152: C16.+ 94.14,44.25 94.14,41.25 C15.-
  Bottom 0.152: IC6.5 80.14,33 88.14,41 93.89,41 C15.-
N$14
  Top 0.152: R9.1 94.14,34.5 94.14,38.25 C15.+
PHI0
  Top 0.152: U$1.21 48.14,2.75 50.64,5.25 50.64,25.75 53.14,28.25 53.14,56.25 55.89,59 55.89,60.75 56.39,61.25 59.39,61.25 59.39,59.75 IC7.22
R/~W  (via drill 0.35)
  Top 0.152: v64.14,8.75 v59.39,4
  Bottom 0.152: v59.39,4 59.14,4.25 42.14,4.25 40.64,2.75 U$1.24 | v64.14,8.75 82.89,8.75 85.39,11.25 IC4.3
VCC
  Top 0.152: IC7.28 44.39,59.5 46.14,57.75 51.64,57.75 51.64,59.5 IC7.25 | 78.64,16.5 80.39,16.5 80.39,18.75 IC4.16 | 78.64,16.5 77.14,16.5 C4.2 | 77.89,32.5 78.64,31.75 78.64,16.5 | 77.89,32.5 77.64,32.75 IC6.6 77.89,32.5 | 77.89,32.5 77.89,56 72.64,61.25 J-CS0.3 | 54.64,16.5 55.64,16.5 55.64,18.75 IC3.16 55.89,19 55.89,20.75 62.39,20.75 68.89,27.25 68.89,29 67.89,30 C6.2 | 54.64,16.5 52.39,16.5 C3.2 | 54.64,16.5 54.64,3.75 55.64,2.75 U$1.18 | IC7.40 13.64,59.5 10.89,56.75 10.89,53.25 C7.2 | C5.2 2.89,27.75 5.14,25.5 5.14,20 6.14,19 IC1.16 | R1.2 6.64,52 7.64,51 7.64,32 6.39,30.75 IC5.14
  Bottom 0.152: J-CS0.3 72.39,61.5 70.64,63.25 55.39,63.25 51.89,59.75 IC7.25 | 82.39,31.75 78.64,31.75 77.64,32.75 IC6.6 | 82.39,31.75 89.64,31.75 93.89,27.5 C17.+ | R1.2 6.64,52.25 7.39,53 10.64,53 C7.2 | C5.2 2.89,28 5.39,30.5 6.14,30.5 IC5.14 | 3.64,17.25 5.14,18.75 6.14,18.75 IC1.16 | 3.64,17.25 2.89,16.5 C1.2 | 3.64,17.25 26.64,17.25 27.39,16.5 C2.2 27.64,16.5 34.64,16.5 | 34.64,16.5 34.64,20 33.89,20.75 32.89,20.75 31.14,19 IC2.16 | 34.64,16.5 52.14,16.5 C3.2 | 82.39,31.75 82.39,30.25 67.89,30.25 C6.2
YH5  (via drill 0.35)
  Top 0.152: v39.39,13.75 39.39,12.25 38.64,11.5 IC2.4
  Bottom 0.152: v39.39,13.75 40.89,15.25 71.64,15.25 72.39,16 72.39,18.75 71.14,18.75 IC3.10
YL5  (via drill 0.35)
  Top 0.152: v31.14,22.5 40.14,22.5 40.14,12.25 40.89,11.5 IC2.5
  Bottom 0.152: v31.14,22.5 29.89,21.25 21.39,21.25 19.14,19 IC1.11
~CS  (via drill 0.35)
  Top 0.152: v33.14,15.25 33.39,15.5 33.39,18.75 IC2.15
  Bottom 0.152: v33.14,15.25 5.14,15.25 5.14,2.75 U$1.38 | IC4.4 87.89,11.5 87.89,17.25 84.89,17.25 84.14,18 84.14,22 31.89,22 29.89,20 29.89,17.25 31.89,17.25 33.39,18.75 IC2.15
~RESET
  Top 0.152: U$1.20 50.89,2.75 51.14,3 51.14,25.5 53.89,28.25 53.89,41.75 55.89,43.75 55.89,58.25 56.89,59.25 56.89,59.5 IC7.23

### Text on the board
tNames: CH LEFT/CH RIGHT | A2 | VCC | VCC | A2 | BO6502 -AUDIO rev. 03 | AMPLI ON | R470 OFF | ~CS | D7 | D6 | D5 | D4 | D3 | D2 | D1 | D0 | R/~W | ~IRQ | PHI0 | ~RESET | VCC | GND | A0 | A1 | A2 | A3 | A4 | A5 | A6 | A7 | A8 | A9 | A10 | A11 | A12 | A13 | A14 | A15
bNames: BO6502 -AUDIO rev. 03